# Altium schematic sheet ESP32-S31.SchDoc
size A3; SheetNumber: 2; SheetTotal: 4
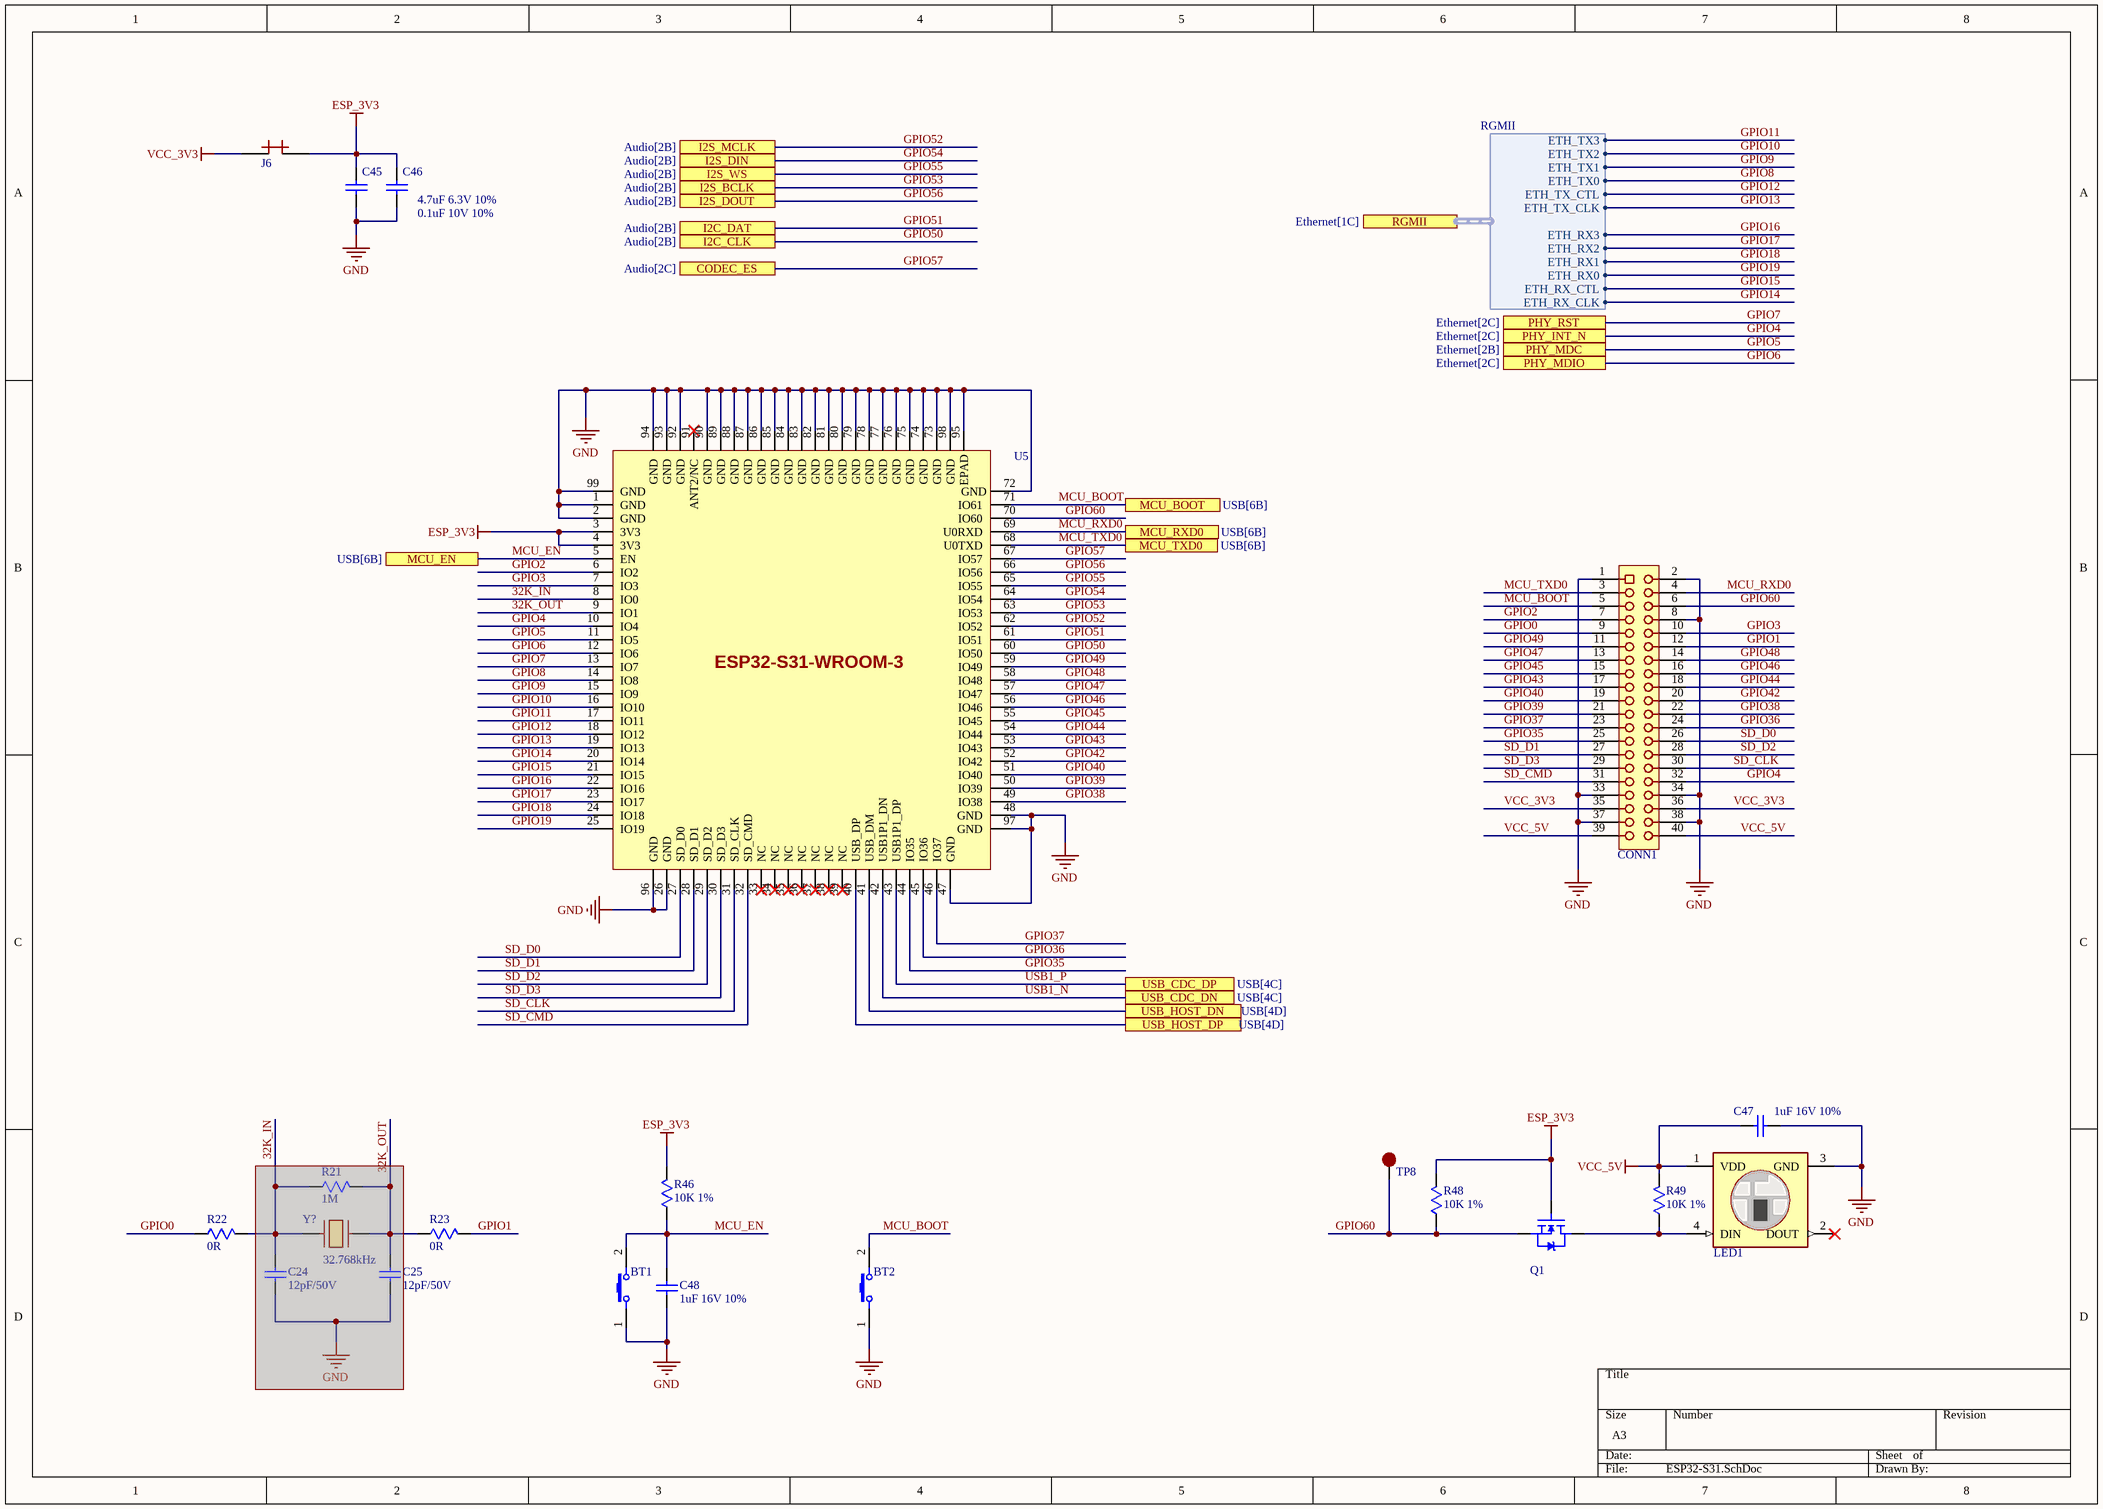
[diagram p0: ESP32-S31.SchDoc]

## Parts
BT1  Button-2  [SW_B3U-1000PM]  (value not drawn)
BT2  Button-2  [SW_B3U-1000PM]  (value not drawn)
C24  12pF/50V  [C0402]  (masked out: inside a compile mask, not in the netlist)
C25  12pF/50V  [C0402]  (masked out: inside a compile mask, not in the netlist)
C45  4.7uF 6.3V 10%  [C0603]
C46  0.1uF 10V 10%  [C0402]
C47  1uF 16V 10%  [C0603]
C48  1uF 16V 10%  [C0402]
CONN1  CONNECTOR-2X20  [2.54 2x20]  (value not drawn)
J6  Jump_2.54mm  [2.54 2X1]  (value not drawn)
LED1  ARGB  [WS2812-5050]  (value not drawn)
Q1  Mosfet N Signal  [SOT-23]  (value not drawn)
R21  1M  [R0402]  (masked out: inside a compile mask, not in the netlist)
R22  0R  [R0402]
R23  0R  [R0402]
R46  10K 1%  [R0402]
R48  10K 1%  [R0402]
R49  10K 1%  [R0402]
TP8  Test point  [TP]  (value not drawn)
U5  ESP32-S31-WROOM-3  [ESP32-S31-WROOM-3]  (value not drawn)
Y?  32.768kHz  [XTAL 2P 3215]  (masked out: inside a compile mask, not in the netlist)

## Ports
CODEC_ES (see Audio[2C]), I2C_CLK (see Audio[2B]), I2C_DAT (see Audio[2B]), I2S_BCLK (see Audio[2B]), I2S_DIN (see Audio[2B]), I2S_DOUT (see Audio[2B]), I2S_MCLK (see Audio[2B]), I2S_WS (see Audio[2B]), MCU_BOOT (see USB[6B]), MCU_EN (see USB[6B]), MCU_RXD0 (see USB[6B]), MCU_TXD0 (see USB[6B]), PHY_INT_N (see Ethernet[2C]), PHY_MDC (see Ethernet[2B]), PHY_MDIO (see Ethernet[2C]), PHY_RST (see Ethernet[2C]), RGMII (harness RGMII, see Ethernet[1C]), USB_CDC_DN (see USB[4C]), USB_CDC_DP (see USB[4C]), USB_HOST_DN (see USB[4D]), USB_HOST_DP (see USB[4D])

## Harnesses
RGMII: ETH_TX1, ETH_TX0, ETH_TX_CTL, ETH_TX_CLK, ETH_RX0, ETH_RX_CTL, ETH_RX_CLK, ETH_TX2, ETH_TX3, ETH_RX1, ETH_RX2, ETH_RX3

## Nets
ESP_3V3: C45.2 C46.2 J6.2 Q1.1(G) R46.1 R48.1 U5.3(3V3) U5.4(3V3)
GND: BT1.1 BT2.1 C45.1 C46.1 C47.1 C48.2 CONN1.1 CONN1.2 CONN1.8 CONN1.33 CONN1.34 CONN1.37 CONN1.38 LED1.3(GND) U5.1(GND) U5.2(GND) U5.26(GND) U5.47(GND) U5.48(GND) U5.72(GND) U5.73(GND) U5.74(GND) U5.75(GND) U5.76(GND) U5.77(GND) U5.78(GND) U5.79(GND) U5.80(GND) U5.81(GND) U5.82(GND) U5.83(GND) U5.84(GND) U5.85(GND) U5.86(GND) U5.87(GND) U5.88(GND) U5.89(GND) U5.90(GND) U5.92(GND) U5.93(GND) U5.94(GND) U5.95(EPAD) U5.96(GND) U5.97(GND) U5.98(GND) U5.99(GND)
VCC_3V3: CONN1.35 CONN1.36 J6.1
VCC_5V: C47.2 CONN1.39 CONN1.40 LED1.1(VDD) R49.1
32K_IN: U5.8(IO0)
32K_OUT: U5.9(IO1)
GPIO0: CONN1.9 R22.1
GPIO1: CONN1.12 R23.1
GPIO2: CONN1.7 U5.6(IO2)
GPIO3: CONN1.10 U5.7(IO3)
GPIO4: CONN1.32 U5.10(IO4) ; port PHY_INT_N
GPIO5: U5.11(IO5) ; port PHY_MDC
GPIO6: U5.12(IO6) ; port PHY_MDIO
GPIO7: U5.13(IO7) ; port PHY_RST
GPIO8: U5.14(IO8) ; port RGMII.ETH_TX0
GPIO9: U5.15(IO9) ; port RGMII.ETH_TX1
GPIO10: U5.16(IO10) ; port RGMII.ETH_TX2
GPIO11: U5.17(IO11) ; port RGMII.ETH_TX3
GPIO12: U5.18(IO12) ; port RGMII.ETH_TX_CTL
GPIO13: U5.19(IO13) ; port RGMII.ETH_TX_CLK
GPIO14: U5.20(IO14) ; port RGMII.ETH_RX_CLK
GPIO15: U5.21(IO15) ; port RGMII.ETH_RX_CTL
GPIO16: U5.22(IO16) ; port RGMII.ETH_RX3
GPIO17: U5.23(IO17) ; port RGMII.ETH_RX2
GPIO18: U5.24(IO18) ; port RGMII.ETH_RX1
GPIO19: U5.25(IO19) ; port RGMII.ETH_RX0
GPIO35: CONN1.25 U5.44(IO35)
GPIO36: CONN1.24 U5.45(IO36)
GPIO37: CONN1.23 U5.46(IO37)
GPIO38: CONN1.22 U5.49(IO38)
GPIO39: CONN1.21 U5.50(IO39)
GPIO40: CONN1.19 U5.51(IO40)
GPIO42: CONN1.20 U5.52(IO42)
GPIO43: CONN1.17 U5.53(IO43)
GPIO44: CONN1.18 U5.54(IO44)
GPIO45: CONN1.15 U5.55(IO45)
GPIO46: CONN1.16 U5.56(IO46)
GPIO47: CONN1.13 U5.57(IO47)
GPIO48: CONN1.14 U5.58(IO48)
GPIO49: CONN1.11 U5.59(IO49)
GPIO50: U5.60(IO50) ; port I2C_CLK
GPIO51: U5.61(IO51) ; port I2C_DAT
GPIO52: U5.62(IO52) ; port I2S_MCLK
GPIO53: U5.63(IO53) ; port I2S_BCLK
GPIO54: U5.64(IO54) ; port I2S_DIN
GPIO55: U5.65(IO55) ; port I2S_WS
GPIO56: U5.66(IO56) ; port I2S_DOUT
GPIO57: U5.67(IO57) ; port CODEC_ES
GPIO60: CONN1.6 Q1.2(D) R48.2 TP8.1(EPAD) U5.70(IO60)
MCU_BOOT: BT2.2 CONN1.5 U5.71(IO61) ; port MCU_BOOT
MCU_EN: BT1.2 C48.1 R46.2 U5.5(EN) ; port MCU_EN
MCU_RXD0: CONN1.4 U5.69(U0RXD) ; port MCU_RXD0
MCU_TXD0: CONN1.3 U5.68(U0TXD) ; port MCU_TXD0
SD_CLK: CONN1.30 U5.31(SD_CLK)
SD_CMD: CONN1.31 U5.32(SD_CMD)
SD_D0: CONN1.26 U5.27(SD_D0)
SD_D1: CONN1.27 U5.28(SD_D1)
SD_D2: CONN1.28 U5.29(SD_D2)
SD_D3: CONN1.29 U5.30(SD_D3)
USB1_N: U5.42(USB1P1_DN) ; port USB_CDC_DN
USB1_P: U5.43(USB1P1_DP) ; port USB_CDC_DP
USB_HOST_DN: U5.41(USB_DM) ; port USB_HOST_DN
USB_HOST_DP: U5.40(USB_DP) ; port USB_HOST_DP
NetLED1_4: LED1.4(DIN) Q1.3(S) R49.2

Not connected (* = marked no-connect by the designer): LED1 2(DOUT)*; R22 2; R23 2; U5 33(NC)* 34(NC)* 35(NC)* 36(NC)* 37(NC)* 38(NC)* 39(NC)* 91(ANT2/NC)*

## Library data of the parts
C24 C25 C45-C48 = Capacitor_Ceramic
LED1 = ARGB: 5050 symphony LED SMD; MF: Xinglight; MP: XL-5050RGBC-WS2812B; SnapEDA_Link: https://www.snapeda.com/parts/XL-5050RGBC-WS2812B/Xinglight/view-part/?ref=snap; Package: Package; Value: *; Check_prices: https://www.snapeda.com/parts/XL-5050RGBC-WS2812B/Xinglight/view-part/?ref=eda
Q1 = 2N7000
R21-R23 R46 R48 R49 = Resistor
Y? = Crystal 2 Pin: LOW FREQUENCY CRYSTAL; MF: Micro Crystal; MP: CM7V-T1A-LOW-ESR-32.768KHZ-12.5PF-20-TA-QC; Package: SMD-2 Micro Crystal; Value: *; Check_prices: https://www.snapeda.com/parts/CM7V-T1A-LOW-ESR-32.768KHZ-12.5PF-20-TA-QC/Micro+Crystal/view-part/?ref=eda; SnapEDA_Link: https://www.snapeda.com/parts/CM7V-T1A-LOW-ESR-32.768KHZ-12.5PF-20-TA-QC/Micro+Crystal/view-part/?ref=snap; Availability: In Stock; Purchase-URL: https://pricing.snapeda.com/search/part/CM7V-T1A-LOW-ESR-32.768KHZ-12.5PF-20-TA-QC/?ref=eda; Price: None